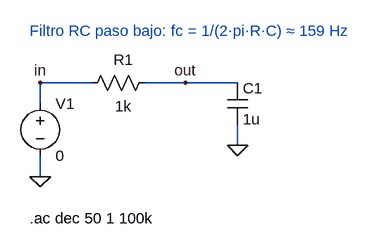
[diagram p0: schematic RC respuesta en frecuencia.asc]
RC respuesta en frecuencia.asc, the LTspice schematic file:
Version 4
SHEET 1 880 680
WIRE 80 0 0 0
WIRE 304 0 160 0
WIRE 0 32 0 0
WIRE 304 96 304 64
WIRE 0 144 0 112
FLAG 0 144 0
FLAG 304 96 0
FLAG 0 0 in
FLAG 224 0 out
SYMBOL voltage 0 16 R0
SYMATTR InstName V1
SYMATTR Value 0
SYMATTR Value2 AC 1
SYMBOL res 64 16 R270
WINDOW 0 36 64 VTop 2
WINDOW 3 -4 64 VBottom 2
SYMATTR InstName R1
SYMATTR Value 1k
SYMBOL cap 288 0 R0
SYMATTR InstName C1
SYMATTR Value 1u
TEXT -16 208 Left 2 !.ac dec 50 1 100k
TEXT -16 -80 Left 2 ;Filtro RC paso bajo: fc = 1/(2·pi·R·C) ≈ 159 Hz

The netlist it stands for:
* RC respuesta en frecuencia.asc
V1 in 0 0 AC 1
R1 in out 1k
C1 out 0 1u
.ac dec 50 1 100k
* Filtro RC paso bajo: fc = 1/(2·pi·R·C) ≈ 159 Hz
.backanno
.end